# Altium project OmniCore_SDR.PrjPcb (part 3 of 3)
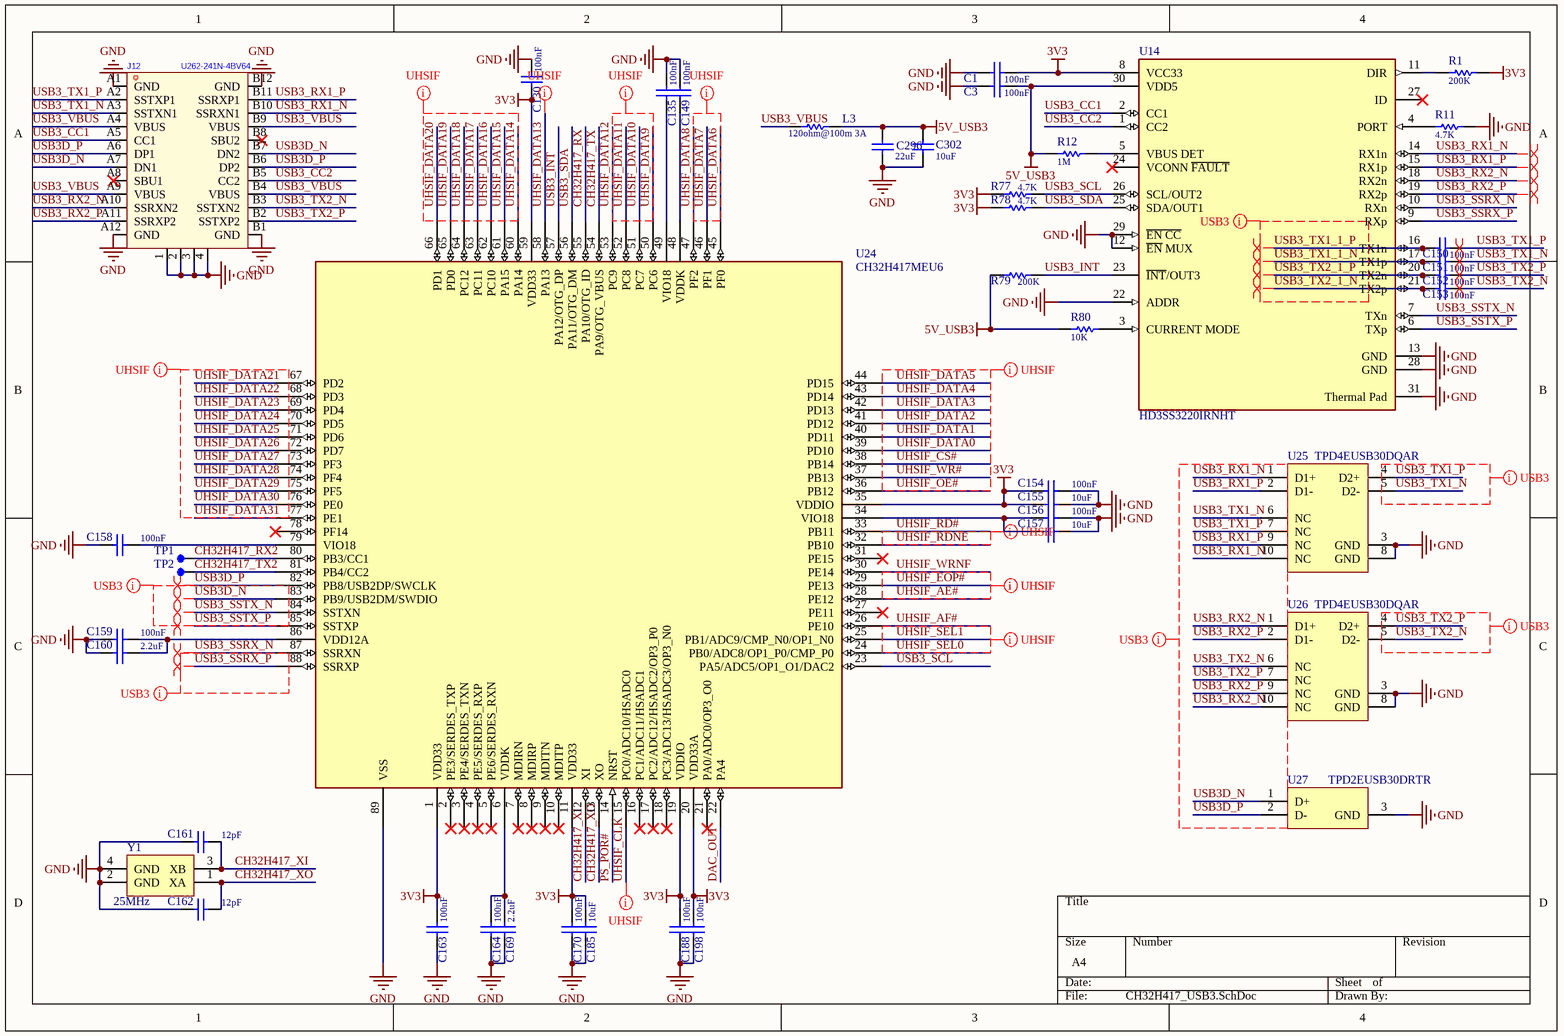
[diagram p11: CH32H417_USB3.SchDoc]

## Nets that join several sheets
1V0: ZYNQ_Power (37 pins), Sys_Power (6 pins)
1V8: PS_IO (R5.1 R6.1), ZYNQ_Power (56 pins), LAN_SD (11 pins), JTAG (8 pins), AD9361 (6 pins), Sys_Power (15 pins)
1V35: PS_IO (R28.1), ZYNQ_Power (23 pins), DDR3 (78 pins), Sys_Power (5 pins)
3V3: PL_IO (C112.1 D4.4 R13.1 R14.1), PS_IO (14 pins), ZYNQ_Power (36 pins), DDR3 (C126.1 R29.2 U20.7 U20.10), LAN_SD (14 pins), JTAG (20 pins), Sys_Power (5 pins), Clock (21 pins), CH32H417_USB3 (19 pins)
5V: PL_IO (J7.1 J7.2 J8.1), Sys_Power (22 pins)
5V_USB2: JTAG (C171.1 C178.1 L5.1), Sys_Power (5 pins)
5V_USB3: Sys_Power (5 pins), CH32H417_USB3 (8 pins)
GND: PL_IO (11 pins), PS_IO (23 pins), ZYNQ_Power (150 pins), DDR3 (103 pins), LAN_SD (42 pins), JTAG (36 pins), AD9361 (68 pins), AD9361_RF (30 pins), Sys_Power (61 pins), Clock (43 pins), CH32H417_USB3 (46 pins)
VDD_DIG: AD9361 (14 pins), AD9361_RF (12 pins), Sys_Power (6 pins)
VDDA_RX_LO: AD9361 (16 pins), Sys_Power (6 pins)
VTTREF: PS_IO (C6.2 C7.2 U1.H6 U1.P6), DDR3 (10 pins)
AD9361_CLK_IN: AD9361 (C199.2 R88.2), Clock (R140.1)
AD9361_CLK_OUT: PL_IO (U1.U10), AD9361 (U11.J6)
AD9361_CTRL_IN0: PL_IO (U1.T10), AD9361 (U11.C5)
AD9361_CTRL_IN1: PL_IO (U1.Y12), AD9361 (U11.C6)
AD9361_CTRL_IN2: PL_IO (U1.Y13), AD9361 (U11.D6)
AD9361_CTRL_IN3: PL_IO (U1.V11), AD9361 (U11.D5)
AD9361_CTRL_OUT0: PL_IO (U1.T11), AD9361 (U11.D4)
AD9361_CTRL_OUT1: PL_IO (U1.T14), AD9361 (U11.E4)
AD9361_CTRL_OUT2: PL_IO (U1.T15), AD9361 (U11.E5)
AD9361_CTRL_OUT3: PL_IO (U1.T17), AD9361 (U11.E6)
AD9361_CTRL_OUT4: PL_IO (U1.T19), AD9361 (U11.F6)
AD9361_CTRL_OUT5: PL_IO (U1.T20), AD9361 (U11.F5)
AD9361_CTRL_OUT6: PL_IO (R2.2 U1.U13), AD9361 (U11.F4)
AD9361_CTRL_OUT7: PL_IO (U1.V13), AD9361 (U11.G4)
AD9361_DATA_CLK_N: PL_IO (U1.P20), AD9361 (U11.H11)
AD9361_DATA_CLK_P: PL_IO (U1.N20), AD9361 (U11.G11)
AD9361_EN_AGC: PL_IO (U1.P16), AD9361 (U11.G5)
AD9361_ENABLE: PL_IO (U1.R18), AD9361 (U11.G6)
AD9361_FB_CLK_N: PL_IO (U1.P19), AD9361 (U11.G10)
AD9361_FB_CLK_P: PL_IO (U1.N18), AD9361 (U11.F10)
AD9361_RESET: PL_IO (U1.N17), AD9361 (R119.1 U11.K5)
AD9361_RX_D0_N: PL_IO (U1.Y19), AD9361 (U11.K11)
AD9361_RX_D0_P: PL_IO (U1.Y18), AD9361 (U11.J12)
AD9361_RX_D1_N: PL_IO (U1.V18), AD9361 (U11.K10)
AD9361_RX_D1_P: PL_IO (U1.V17), AD9361 (U11.J11)
AD9361_RX_D2_N: PL_IO (U1.W20), AD9361 (U11.K9)
AD9361_RX_D2_P: PL_IO (U1.V20), AD9361 (U11.J10)
AD9361_RX_D3_N: PL_IO (U1.R17), AD9361 (U11.K8)
AD9361_RX_D3_P: PL_IO (U1.R16), AD9361 (U11.J9)
AD9361_RX_D4_N: PL_IO (U1.W19), AD9361 (U11.K7)
AD9361_RX_D4_P: PL_IO (U1.W18), AD9361 (U11.J8)
AD9361_RX_D5_N: PL_IO (U1.W16), AD9361 (U11.J7)
AD9361_RX_D5_P: PL_IO (U1.V16), AD9361 (U11.H8)
AD9361_RX_FRAME_N: PL_IO (U1.U19), AD9361 (U11.G7)
AD9361_RX_FRAME_P: PL_IO (U1.U18), AD9361 (U11.G8)
AD9361_RXLO_EXT: AD9361 (U11.G1), Clock (C291.2 R83.1)
AD9361_SPI_CLK: PL_IO (U1.R14), AD9361 (U11.J5)
AD9361_SPI_DI: PL_IO (U1.P15), AD9361 (U11.J4)
AD9361_SPI_DO: PL_IO (U1.R19), AD9361 (U11.L6)
AD9361_SPI_ENB: PL_IO (U1.P18), AD9361 (U11.K6)
AD9361_SYNC: PL_IO (U1.U20), AD9361 (J1.1 R62.1 U11.H5)
AD9361_TX_D0_N: PL_IO (U1.Y14), AD9361 (U11.E12)
AD9361_TX_D0_P: PL_IO (U1.W14), AD9361 (U11.D11)
AD9361_TX_D1_N: PL_IO (U1.U12), AD9361 (U11.E11)
AD9361_TX_D1_P: PL_IO (U1.T12), AD9361 (U11.D10)
AD9361_TX_D2_N: PL_IO (U1.U15), AD9361 (U11.E10)
AD9361_TX_D2_P: PL_IO (U1.U14), AD9361 (U11.D9)
AD9361_TX_D3_N: PL_IO (U1.U17), AD9361 (U11.E9)
AD9361_TX_D3_P: PL_IO (U1.T16), AD9361 (U11.D8)
AD9361_TX_D4_N: PL_IO (U1.W13), AD9361 (U11.E8)
AD9361_TX_D4_P: PL_IO (U1.V12), AD9361 (U11.D7)
AD9361_TX_D5_N: PL_IO (U1.W15), AD9361 (U11.F8)
AD9361_TX_D5_P: PL_IO (U1.V15), AD9361 (U11.E7)
AD9361_TX_FRAME_N: PL_IO (U1.Y17), AD9361 (U11.H9)
AD9361_TX_FRAME_P: PL_IO (U1.Y16), AD9361 (U11.G9)
AD9361_TXLO_EXT: AD9361 (U11.A12), Clock (C290.2 R82.1)
AD9361_TXNRX: PL_IO (U1.P14), AD9361 (U11.H4)
ADF4001_CE: PS_IO (U1.D9), Clock (R137.1)
ADF4001_CLK: PS_IO (U1.B5), Clock (R125.1)
ADF4001_DATA: PS_IO (U1.E9), Clock (R132.1)
ADF4001_LE: PS_IO (U1.E8), Clock (R133.1)
CH32H417_RX: PL_IO (U1.H18), CH32H417_USB3 (U24.55)
CH32H417_TX: PL_IO (U1.G19), CH32H417_USB3 (U24.54)
CLK_FB_FPGA: PL_IO (U1.H17), Clock (R141.1)
DAC_OUT: Clock (5 pins), CH32H417_USB3 (U24.22)
DDR3_A0: PS_IO (U1.N2), DDR3 (R31.2 U2.N3 U3.N3)
DDR3_A1: PS_IO (U1.K2), DDR3 (R32.2 U2.P7 U3.P7)
DDR3_A2: PS_IO (U1.M3), DDR3 (R33.2 U2.P3 U3.P3)
DDR3_A3: PS_IO (U1.K3), DDR3 (R34.2 U2.N2 U3.N2)
DDR3_A4: PS_IO (U1.M4), DDR3 (R35.2 U2.P8 U3.P8)
DDR3_A5: PS_IO (U1.L1), DDR3 (R36.2 U2.P2 U3.P2)
DDR3_A6: PS_IO (U1.L4), DDR3 (R37.2 U2.R8 U3.R8)
DDR3_A7: PS_IO (U1.K4), DDR3 (R38.2 U2.R2 U3.R2)
DDR3_A8: PS_IO (U1.K1), DDR3 (R39.2 U2.T8 U3.T8)
DDR3_A9: PS_IO (U1.J4), DDR3 (R40.2 U2.R3 U3.R3)
DDR3_A10: PS_IO (U1.F5), DDR3 (R41.2 U2.L7 U3.L7)
DDR3_A11: PS_IO (U1.G4), DDR3 (R42.2 U2.R7 U3.R7)
DDR3_A12: PS_IO (U1.E4), DDR3 (R43.2 U2.N7 U3.N7)
DDR3_A13: PS_IO (U1.D4), DDR3 (R44.2 U2.T3 U3.T3)
DDR3_A14: PS_IO (U1.F4), DDR3 (R45.2 U2.T7 U3.T7)
DDR3_BA0: PS_IO (U1.L5), DDR3 (R46.2 U2.M2 U3.M2)
DDR3_BA1: PS_IO (U1.R4), DDR3 (R47.2 U2.N8 U3.N8)
DDR3_BA2: PS_IO (U1.J5), DDR3 (R48.2 U2.M3 U3.M3)
DDR3_CAS: PS_IO (U1.P5), DDR3 (R51.2 U2.K3 U3.K3)
DDR3_CKE: PS_IO (U1.N3), DDR3 (R54.2 U2.K9 U3.K9)
DDR3_CLK0_N: PS_IO (U1.M2), DDR3 (R57.1 U2.K7 U3.K7)
DDR3_CLK0_P: PS_IO (U1.L2), DDR3 (R57.2 U2.J7 U3.J7)
DDR3_D0: PS_IO (U1.C3), DDR3 (U2.F8)
DDR3_D1: PS_IO (U1.B3), DDR3 (U2.G2)
DDR3_D2: PS_IO (U1.A2), DDR3 (U2.F2)
DDR3_D3: PS_IO (U1.A4), DDR3 (U2.H3)
DDR3_D4: PS_IO (U1.D3), DDR3 (U2.H8)
DDR3_D5: PS_IO (U1.D1), DDR3 (U2.F7)
DDR3_D6: PS_IO (U1.C1), DDR3 (U2.E3)
DDR3_D7: PS_IO (U1.E1), DDR3 (U2.H7)
DDR3_D8: PS_IO (U1.E2), DDR3 (U2.C3)
DDR3_D9: PS_IO (U1.E3), DDR3 (U2.C2)
DDR3_D10: PS_IO (U1.G3), DDR3 (U2.A3)
DDR3_D11: PS_IO (U1.H3), DDR3 (U2.A2)
DDR3_D12: PS_IO (U1.J3), DDR3 (U2.C8)
DDR3_D13: PS_IO (U1.H2), DDR3 (U2.A7)
DDR3_D14: PS_IO (U1.H1), DDR3 (U2.D7)
DDR3_D15: PS_IO (U1.J1), DDR3 (U2.B8)
DDR3_D16: PS_IO (U1.P1), DDR3 (U3.E3)
DDR3_D17: PS_IO (U1.P3), DDR3 (U3.F2)
DDR3_D18: PS_IO (U1.R3), DDR3 (U3.G2)
DDR3_D19: PS_IO (U1.R1), DDR3 (U3.H3)
DDR3_D20: PS_IO (U1.T4), DDR3 (U3.H7)
DDR3_D21: PS_IO (U1.U4), DDR3 (U3.H8)
DDR3_D22: PS_IO (U1.U2), DDR3 (U3.F7)
DDR3_D23: PS_IO (U1.U3), DDR3 (U3.F8)
DDR3_D24: PS_IO (U1.V1), DDR3 (U3.A3)
DDR3_D25: PS_IO (U1.Y3), DDR3 (U3.C8)
DDR3_D26: PS_IO (U1.W1), DDR3 (U3.C3)
DDR3_D27: PS_IO (U1.Y4), DDR3 (U3.A7)
DDR3_D28: PS_IO (U1.Y2), DDR3 (U3.D7)
DDR3_D29: PS_IO (U1.W3), DDR3 (U3.B8)
DDR3_D30: PS_IO (U1.V2), DDR3 (U3.A2)
DDR3_D31: PS_IO (U1.V3), DDR3 (U3.C2)
DDR3_DM0: PS_IO (U1.A1), DDR3 (U2.E7)
DDR3_DM1: PS_IO (U1.F1), DDR3 (U2.D3)
DDR3_DM2: PS_IO (U1.T1), DDR3 (U3.E7)
DDR3_DM3: PS_IO (U1.Y1), DDR3 (U3.D3)
DDR3_DQS0_N: PS_IO (U1.B2), DDR3 (U2.G3)
DDR3_DQS0_P: PS_IO (U1.C2), DDR3 (U2.F3)
DDR3_DQS1_N: PS_IO (U1.F2), DDR3 (U2.B7)
DDR3_DQS1_P: PS_IO (U1.G2), DDR3 (U2.C7)
DDR3_DQS2_N: PS_IO (U1.T2), DDR3 (U3.G3)
DDR3_DQS2_P: PS_IO (U1.R2), DDR3 (U3.F3)
DDR3_DQS3_N: PS_IO (U1.W4), DDR3 (U3.B7)
DDR3_DQS3_P: PS_IO (U1.W5), DDR3 (U3.C7)
DDR3_ODT: PS_IO (U1.N5), DDR3 (R53.2 U2.K1 U3.K1)
DDR3_RAS: PS_IO (U1.P4), DDR3 (R50.2 U2.J3 U3.J3)
DDR3_RESET: PS_IO (U1.B4), DDR3 (R58.1 U2.T2 U3.T2)
DDR3_S0: PS_IO (U1.N1), DDR3 (R49.2 U2.L2 U3.L2)
DDR3_WE: PS_IO (U1.M5), DDR3 (R52.2 U2.L3 U3.L3)
ETH_MDC: PS_IO (U1.C10), LAN_SD (U6.13)
ETH_MDIO: PS_IO (U1.C11), LAN_SD (U6.14)
ETH_RX_CLK: PS_IO (U1.B17), LAN_SD (R70.2 U6.27)
ETH_RX_CTRL: PS_IO (U1.D13), LAN_SD (R68.2 U6.26)
ETH_RXD0: PS_IO (U1.D11), LAN_SD (R64.2 U6.25)
ETH_RXD1: PS_IO (U1.A16), LAN_SD (R65.2 U6.24)
ETH_RXD2: PS_IO (U1.F15), LAN_SD (R66.2 U6.23)
ETH_RXD3: PS_IO (U1.A15), LAN_SD (R67.2 U6.22)
ETH_TX_CLK: PS_IO (U1.A19), LAN_SD (U6.20)
ETH_TX_CTRL: PS_IO (U1.F14), LAN_SD (U6.19)
ETH_TXD0: PS_IO (U1.E14), LAN_SD (U6.18)
ETH_TXD1: PS_IO (U1.B18), LAN_SD (U6.17)
ETH_TXD2: PS_IO (U1.D10), LAN_SD (U6.16)
ETH_TXD3: PS_IO (U1.A17), LAN_SD (U6.15)
PPS_EXT: PL_IO (U1.Y7), Clock (J6.1 R144.2)
PS_POR#: PS_IO (R4.2 U1.C7 U9.2), LAN_SD (U6.12), CH32H417_USB3 (U24.14)
QSPI_CLK: PS_IO (R8.1 R16.1), LAN_SD (U4.6)
QSPI_CS: PS_IO (U1.A7), LAN_SD (R63.1 U4.1)
QSPI_IO_0: PS_IO (R10.1 U1.B8), LAN_SD (U4.5)
QSPI_IO_1: PS_IO (R15.1 U1.D6), LAN_SD (U4.2)
QSPI_IO_2: PS_IO (R23.2 U1.B7), LAN_SD (U4.3)
QSPI_IO_3: PS_IO (R20.2 U1.A6), LAN_SD (U4.7)
SD_CLK: PS_IO (R26.1), LAN_SD (U5.7)
SD_CMD: PS_IO (U1.C17), LAN_SD (U5.6)
SD_D0: PS_IO (U1.E12), LAN_SD (U5.1)
SD_D1: PS_IO (U1.A9), LAN_SD (U5.3)
SD_D2: PS_IO (U1.F13), LAN_SD (U5.4)
SD_D3: PS_IO (U1.B15), LAN_SD (U5.5)
TCK: PS_IO (U1.F9), JTAG (R91.1 R95.1)
TDI: PS_IO (U1.G6), JTAG (R92.1 R96.1)
TDO: PS_IO (U1.F6), JTAG (R93.1 R97.1)
TMS: PS_IO (U1.J6), JTAG (R94.1 R98.1)
TRIG: PL_IO (U1.Y6), Clock (R143.2)
UART_RX: PS_IO (U1.C8), JTAG (R106.1)
UART_TX: PS_IO (U1.C5), JTAG (R105.1)
UHSIF_AE#: PL_IO (U1.E17), CH32H417_USB3 (U24.28)
UHSIF_AF#: PL_IO (U1.F16), CH32H417_USB3 (U24.26)
UHSIF_CLK: PL_IO (U1.H16), CH32H417_USB3 (U24.15)
UHSIF_CS#: PL_IO (U1.J16), CH32H417_USB3 (U24.38)
UHSIF_DATA0: PL_IO (U1.K14), CH32H417_USB3 (U24.39)
UHSIF_DATA1: PL_IO (U1.K16), CH32H417_USB3 (U24.40)
UHSIF_DATA2: PL_IO (U1.L14), CH32H417_USB3 (U24.41)
UHSIF_DATA3: PL_IO (U1.M14), CH32H417_USB3 (U24.42)
UHSIF_DATA4: PL_IO (U1.N15), CH32H417_USB3 (U24.43)
UHSIF_DATA5: PL_IO (U1.N16), CH32H417_USB3 (U24.44)
UHSIF_DATA6: PL_IO (U1.K17), CH32H417_USB3 (U24.45)
UHSIF_DATA7: PL_IO (U1.L15), CH32H417_USB3 (U24.46)
UHSIF_DATA8: PL_IO (U1.L16), CH32H417_USB3 (U24.47)
UHSIF_DATA9: PL_IO (U1.L17), CH32H417_USB3 (U24.50)
UHSIF_DATA10: PL_IO (U1.M15), CH32H417_USB3 (U24.51)
UHSIF_DATA11: PL_IO (U1.F19), CH32H417_USB3 (U24.52)
UHSIF_DATA12: PL_IO (U1.G18), CH32H417_USB3 (U24.53)
UHSIF_DATA13: PL_IO (U1.J18), CH32H417_USB3 (U24.58)
UHSIF_DATA14: PL_IO (U1.J19), CH32H417_USB3 (U24.60)
UHSIF_DATA15: PL_IO (U1.K18), CH32H417_USB3 (U24.61)
UHSIF_DATA16: PL_IO (U1.K19), CH32H417_USB3 (U24.62)
UHSIF_DATA17: PL_IO (U1.M17), CH32H417_USB3 (U24.63)
UHSIF_DATA18: PL_IO (U1.L19), CH32H417_USB3 (U24.64)
UHSIF_DATA19: PL_IO (U1.M18), CH32H417_USB3 (U24.65)
UHSIF_DATA20: PL_IO (U1.M19), CH32H417_USB3 (U24.66)
UHSIF_DATA21: PL_IO (U1.B19), CH32H417_USB3 (U24.67)
UHSIF_DATA22: PL_IO (U1.A20), CH32H417_USB3 (U24.68)
UHSIF_DATA23: PL_IO (U1.B20), CH32H417_USB3 (U24.69)
UHSIF_DATA24: PL_IO (U1.C20), CH32H417_USB3 (U24.70)
UHSIF_DATA25: PL_IO (U1.D20), CH32H417_USB3 (U24.71)
UHSIF_DATA26: PL_IO (U1.F20), CH32H417_USB3 (U24.72)
UHSIF_DATA27: PL_IO (U1.G20), CH32H417_USB3 (U24.73)
UHSIF_DATA28: PL_IO (U1.H20), CH32H417_USB3 (U24.74)
UHSIF_DATA29: PL_IO (U1.J20), CH32H417_USB3 (U24.75)
UHSIF_DATA30: PL_IO (U1.L20), CH32H417_USB3 (U24.76)
UHSIF_DATA31: PL_IO (U1.M20), CH32H417_USB3 (U24.77)
UHSIF_EOP#: PL_IO (U1.E18), CH32H417_USB3 (U24.29)
UHSIF_OE#: PL_IO (U1.J14), CH32H417_USB3 (U24.36)
UHSIF_RD#: PL_IO (U1.H15), CH32H417_USB3 (U24.33)
UHSIF_RDNE: PL_IO (U1.G17), CH32H417_USB3 (U24.32)
UHSIF_SEL0: PL_IO (U1.G14), CH32H417_USB3 (U24.24)
UHSIF_SEL1: PL_IO (U1.G15), CH32H417_USB3 (U24.25)
UHSIF_WR#: PL_IO (U1.J15), CH32H417_USB3 (U24.37)
UHSIF_WRNF: PL_IO (U1.F17), CH32H417_USB3 (U24.30)